# EasyEDA Pro project ProPrj_DRV8701 - 副本_2026-07-18.epro, board PCB1
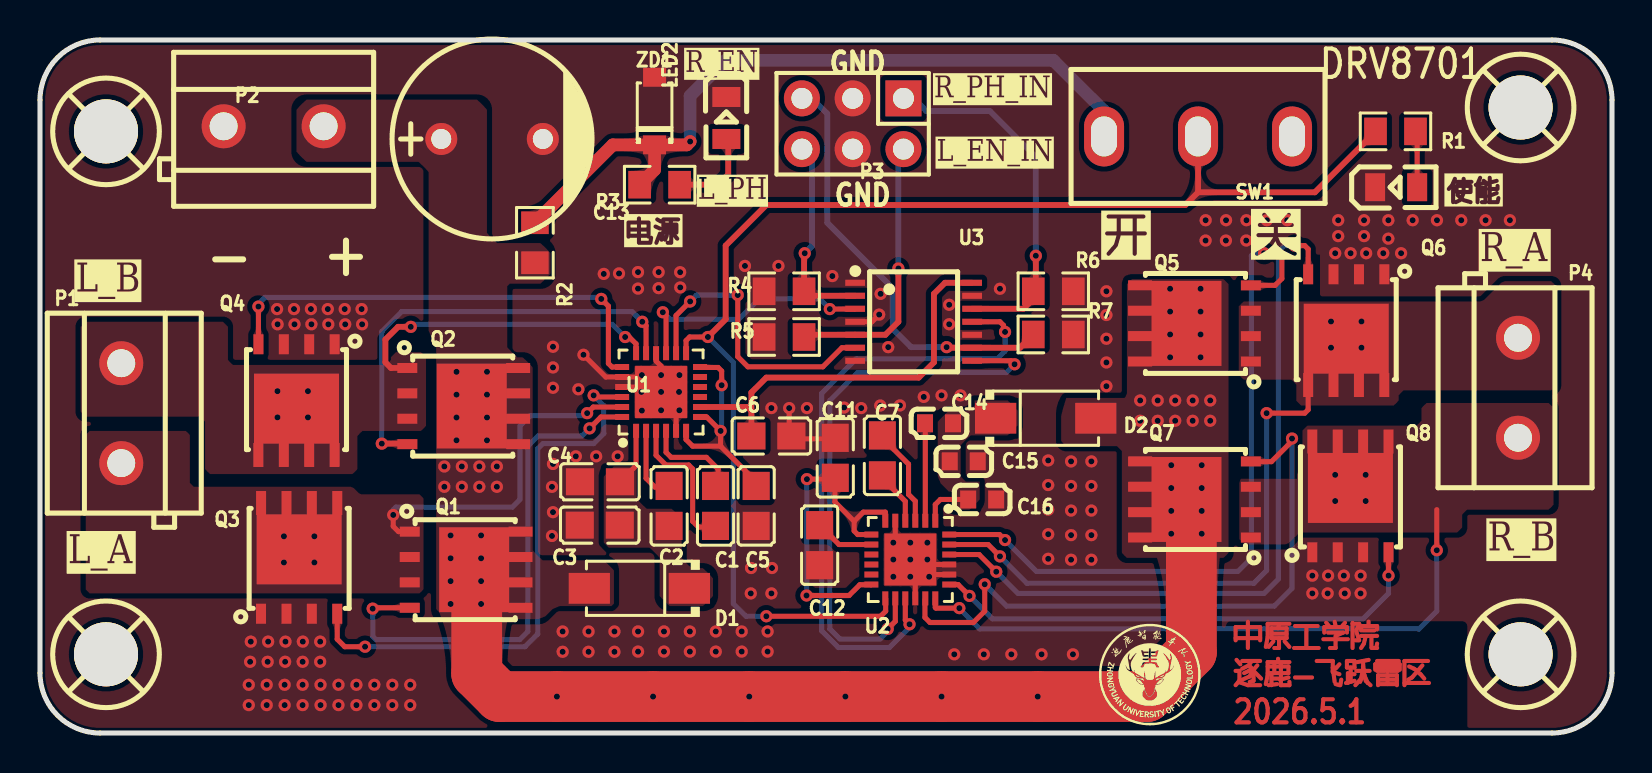
[diagram p4: board, top side]
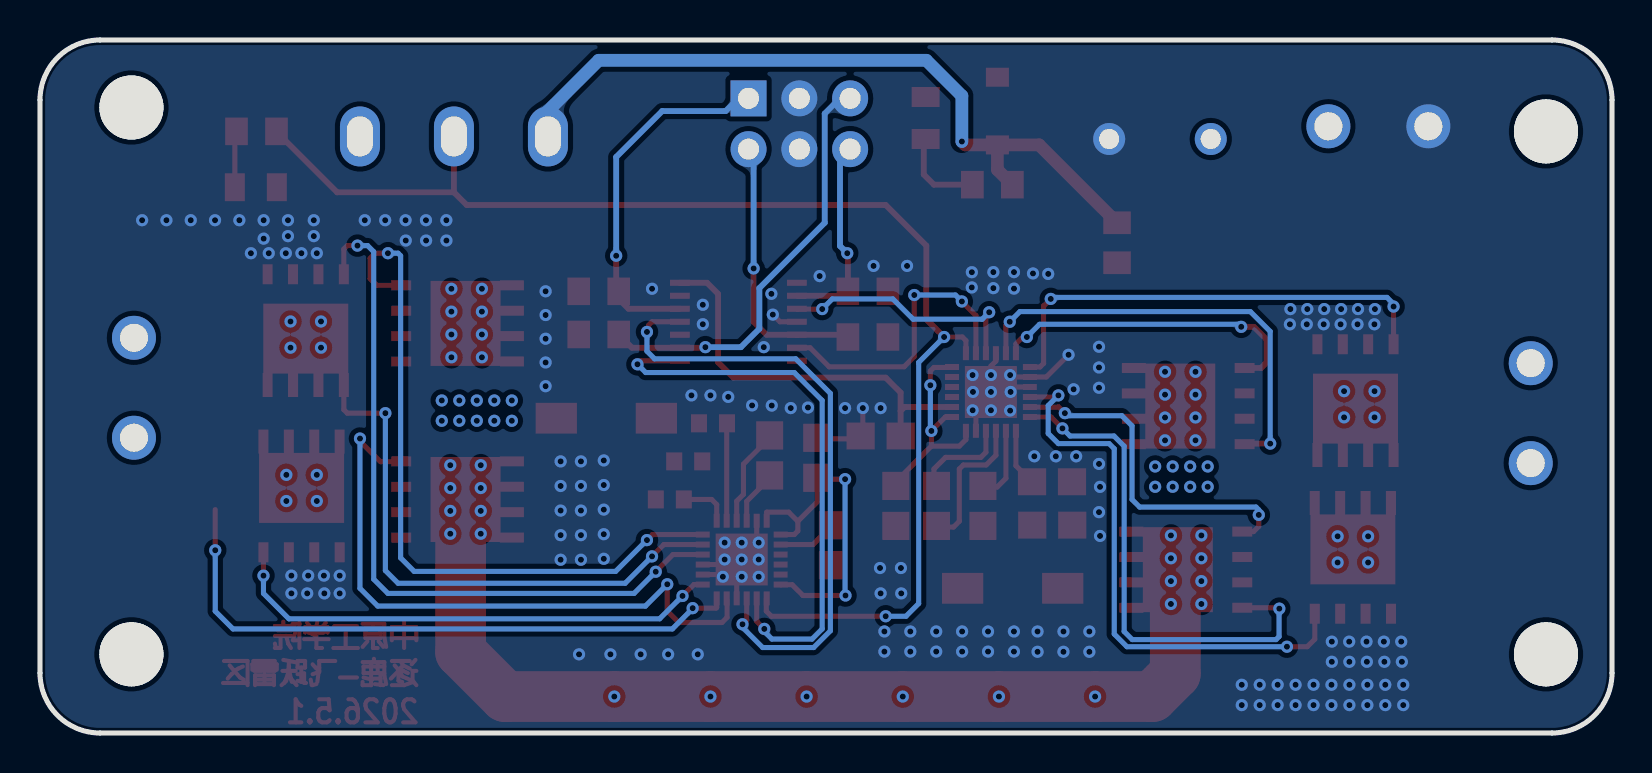
[diagram p5: board, bottom side, seen from below]

Outline 78.61 x 34.67 mm; copper layers: Top Layer, Bottom Layer. Coordinates in mm from the lower left corner of the outline.
Outline path: 0,31.67 0,3 arc(0.88,0.88) 3,0 75.61,0 arc(77.73,0.88) 78.61,3 78.61,31.67 arc(77.73,33.79) 75.61,34.67 3,34.67 arc(0.88,33.79) 0,31.67
Stack: Top Layer 0.035mm / Dielectric1 1.51mm FR4 er 4.5 / Bottom Layer 0.035mm

## Design rules (mm)
template: 自定义配置
spacing copperThickness1oz (default): track to track 0.102, other pairs 0.152 to 0.3
spacing copperThickness2oz: track to track 0.203, other pairs 0.152 to 0.3
track width copperThickness1oz (default): min 0.127, default 0.254, max 2.54
track width copperThickness2oz: min 0.203, default 0.254, max 2.54
differential pair differentialPair (default): width min 0.127, default 0.254, max 2.54; gap min 0.152, default 0.152
via viaSize (default): diameter min 0.5, default 0.61, max 10; hole min 0.3, default 0.305, max 6.3

## Placement (name value [footprint] x y rotation side)
C1  100nF  [C0805]  33.78 11.36 270 top
C2  1uF  [C0805]  31.46 11.36 270 top
C3  10uF  [C0805]  27.99 10.4 180 top
C4  100nF  [C0805]  28 12.57 180 top
C5  1uF  [C0805]  35.81 11.36 90 top
C6  1uF  [C0805]  36.58 14.86 180 top
C7  100nF  [C0805]  42.13 13.89 90 top
C11  1uF  [C0805]  39.77 13.77 270 top
C12  1uF  [C0805]  38.99 9.4 90 top
C13  470uF  [CAP-TH_BD10.0-P5.00-D1.0-FD]  22.61 29.72 0 top
C14  1uF  [C0603]  44.96 15.49 0 top
C15  1uF  [C0603]  46.2 13.59 0 top
C16  1uF  [C0603]  47.12 11.68 0 top
D1  SS54  [SMA_L4.4-W2.8-LS5.4-R-RD]  29.97 7.24 180 top
D2  SS54  [SMA_L4.4-W2.8-LS5.4-R-RD]  50.29 15.75 0 top
LED1  NCD0805R1  [LED0805-R-RD]  67.82 27.31 0 top
LED2  NCD0805R1  [LED0805-R-RD]  34.32 30.77 270 top
P1  KF301-5.0-2P  [CONN-TH_P5.00_KF301-5.0-2P]  4.06 16 270 top
P2  KF301-5.0-2P  [CONN-TH_P5.00_KF301-5.0-2P]  11.68 30.35 180 top
P3  2.54-2*3P针  [HDR-TH_6P-P2.54-V-M-R2-C3-S2.54-1]  40.64 30.48 180 top
P4  KF301-5.0-2P  [CONN-TH_P5.00_KF301-5.0-2P]  73.91 17.27 90 top
Q1  TPH1R403NL,L1Q(M  [DSOP-8_L5.0-W5.0-P1.27-LS6.0-BL-EP]  21.26 8.17 270 top
Q2  TPH1R403NL,L1Q(M  [DSOP-8_L5.0-W5.0-P1.27-LS6.0-BL-EP]  21.14 16.36 270 top
Q3  TPH1R403NL,L1Q(M  [DSOP-8_L5.0-W5.0-P1.27-LS6.0-BL-EP]  12.96 8.74 0 top
Q4  TPH1R403NL,L1Q(M  [DSOP-8_L5.0-W5.0-P1.27-LS6.0-BL-EP]  12.83 16.68 180 top
Q5  TPH1R403NL,L1Q(M  [DSOP-8_L5.0-W5.0-P1.27-LS6.0-BL-EP]  57.78 20.49 90 top
Q6  TPH1R403NL,L1Q(M  [DSOP-8_L5.0-W5.0-P1.27-LS6.0-BL-EP]  65.32 20.18 180 top
Q7  TPH1R403NL,L1Q(M  [DSOP-8_L5.0-W5.0-P1.27-LS6.0-BL-EP]  57.78 11.68 90 top
Q8  TPH1R403NL,L1Q(M  [DSOP-8_L5.0-W5.0-P1.27-LS6.0-BL-EP]  65.53 11.81 0 top
R1  330Ω  [R0805]  67.79 30.1 0 top
R2  2.2kΩ  [R0805]  24.75 24.53 90 top
R3  1kΩ  [R0805]  30.99 27.43 180 top
R4  10kΩ  [R0805]  37.21 22.1 180 top
R5  10kΩ  [R0805]  37.21 19.81 180 top
R6  10kΩ  [R0805]  50.67 22.1 180 top
R7  10kΩ  [R0805]  50.67 19.94 180 top
SCREW1  -  [M3螺丝]  3.3 3.94 0 top
SCREW2  -  [M3螺丝]  74.04 3.94 0 top
SCREW3  -  [M3螺丝]  74.04 31.29 0 top
SCREW4  -  [M3螺丝]  3.3 30.1 0 top
SW1  SS-12D10L5  [SW-TH_SS-12D10L5]  57.91 29.84 180 top
U1  DRV8701ERGET  [VQFN-24_L4.0-W4.0-P0.50-BL-EP2.5]  31.06 17.06 0 top
U2  DRV8701ERGET  [VQFN-24_L4.0-W4.0-P0.50-BL-EP2.5]  43.52 8.68 180 top
U3  SN74HC125PWR  [TSSOP-14_L5.0-W4.4-P0.65-LS6.5-BL]  43.69 20.57 270 top
ZD1  BZT52C3V3  [SOD-123_L2.8-W1.8-LS3.7-RD]  30.73 31.12 90 top

## Footprints (pads in the part's own frame, mm; a bottom-side part is the same pattern mirrored in y, then rotated)
C0603
  rect 0.8x0.9 smd: 1(-0.7,0) 2(0.7,0)
C0805
  rect 1.41x1.35 smd: 1(-1,0) 2(1,0)
CAP-TH_BD10.0-P5.00-D1.0-FD
  round 1.6 hole 1: 1(-2.54,0) 2(2.54,0)
CONN-TH_P5.00_KF301-5.0-2P
  round 2.2 hole 1.4: 1(-2.5,0) 2(2.5,0)
DSOP-8_L5.0-W5.0-P1.27-LS6.0-BL-EP
  rect 0.5x1 smd: 1(-1.905,-2.77) 2(-0.635,-2.77) 3(0.634,-2.77) 4(1.905,-2.77)
  rect 0.5x1.2 smd: 5(1.905,2.77) 6(0.635,2.77) 7(-0.634,2.77) 8(-1.905,2.77)
  custom 4.25x3.5 smd: 9(0,0.45)
HDR-TH_6P-P2.54-V-M-R2-C3-S2.54-1
  rect 1.8x1.8 hole 1.05: 1(-2.54,-1.27)
  round 1.8 hole 1.05: 2(-2.54,1.27) 3(0,-1.27) 4(0,1.27) 5(2.54,-1.27) 6(2.54,1.27)
LED0805-R-RD
  rect 1x1.399 smd: 1(1.05,0) 2(-1.05,0)
M3螺丝
  round 3.2 hole 3.2: 1(0,0)
R0805
  rect 1.133x1.377 smd: 1(-1,0) 2(1,0)
SMA_L4.4-W2.8-LS5.4-R-RD
  rect 2.062x1.539 smd: 1(2.503,0) 2(-2.503,0)
SOD-123_L2.8-W1.8-LS3.7-RD
  rect 0.95x1.15 smd: 1(-1.692,0) 2(1.692,0)
SW-TH_SS-12D10L5
  oval 2x3 hole 1.3x2: 1(-4.7,0) 2(0,0) 3(4.7,0)
TSSOP-14_L5.0-W4.4-P0.65-LS6.5-BL
  rect 0.305x0.991 smd: 1(-1.95,-2.925) 2(-1.3,-2.925) 3(-0.65,-2.925) 4(0,-2.925) 5(0.65,-2.925) 6(1.3,-2.925) 7(1.95,-2.925) 8(1.95,2.925) 9(1.3,2.925) 10(0.65,2.925) 11(0,2.925) 12(-0.65,2.925) 13(-1.3,2.925) 14(-1.95,2.925)
VQFN-24_L4.0-W4.0-P0.50-BL-EP2.5
  rect 0.3x0.7 smd: 1(-1.25,-1.942) 2(-0.75,-1.942) 3(-0.25,-1.942) 4(0.25,-1.942) 5(0.75,-1.942) 6(1.25,-1.942) 13(1.25,1.942) 14(0.75,1.942) 15(0.25,1.942) 16(-0.25,1.942) 17(-0.75,1.942) 18(-1.25,1.942)
  rect 0.7x0.3 smd: 7(1.948,-1.25) 8(1.948,-0.75) 9(1.948,-0.25) 10(1.948,0.25) 11(1.948,0.75) 12(1.948,1.25) 19(-1.948,1.25) 20(-1.948,0.75) 21(-1.948,0.25) 22(-1.948,-0.25) 23(-1.948,-0.75) 24(-1.948,-1.25)
  rect 2.6x2.6 smd: 25(0.001,-0.001)

## Nets
As in the schematic.

Pads without a net: SCREW1 1; SCREW2 1; SCREW3 1; SCREW4 1; SW1 1; U1 9 10 11; U2 9 10 11

## Via types
v1: diameter 0.61, hole 0.305, Top Layer to Bottom Layer, 293 vias

## Routing (per net, layer and track width the routed paths; a pad name or vN(x,y) marks a point on that pad's centre or on a via; arc(x,y) is an arc through that point)
3V3: length 37.8
  Top Layer w0.635: v1(32.51,29.59) 32.34,29.42 ZD1.1 ; ZD1.1 28.64,29.42 R2.2 ; ZD1.1 30.73,28.18 R3.2
  Bottom Layer w0.635: v1(32.51,29.59) 32.51,31.88 34.29,33.66 50.67,33.66 53.21,31.12 SW1.3
DVDD: length 20.1
  Top Layer w0.292: U1.8 35.38,16.31 35.58,16.11 ; C6.2 35.58,16.11 ; 35.58,16.11 35.58,17.03 36.32,17.78 43.94,17.78 44.7,18.54 44.7,21.97 45.26,22.52 U3.14
GND: length 16.5
  Top Layer w0.254: U1.5 31.81,15.98 v1(31.97,16.15) ; v1(44.46,7.82) 44.58,7.93 U2.20 ; U1.16 30.81,18.61 31.06,18.36 v1(31.06,17.91) ; 42.77,10.62 42.77,9.62 v1(42.67,9.53) ; v1(30.08,17.06) 29.83,17.31 U1.21 ; U2.21 44.63,8.43 v1(44.38,8.68) ; v1(30.1,17.91) 30,17.81 U1.20 28.29,17.81 v1(27.18,18.92) ; U2.16 43.77,7.57 v1(43.52,7.82) ; v1(41.97,20.93) 41.61,20.57 U3.4 ; 39.88,14.72 37.72,14.72 37.47,14.97 v1(37.47,16.26)
  vias: v1(10.51,3.56) v1(10.44,2.41) v1(10.44,1.4) v1(10.54,4.57) v1(11.41,4.57) v1(11.38,3.56) v1(11.34,2.41) v1(11.34,1.4) v1(11.86,21.21) v1(11.88,20.45) v1(12.28,4.57) v1(12.26,3.56) v1(12.23,2.41) v1(12.23,1.4) v1(12.7,21.21) v1(12.73,20.45) v1(13.14,4.57) v1(13.14,3.56) v1(13.13,2.41) v1(13.13,1.4) v1(13.55,21.21) v1(13.57,20.45) v1(14.01,4.57) v1(14.01,3.56) v1(14.03,2.41) v1(14.03,1.4) v1(14.39,21.21) v1(14.42,20.45) v1(14.93,2.41) v1(14.93,1.4) v1(15.24,21.21) v1(15.26,20.45) v1(15.82,2.41) v1(15.82,1.4) v1(16.08,21.21) v1(16.11,20.45) v1(16.72,2.41) v1(16.72,1.4) v1(17.62,2.41) v1(17.62,1.4) v1(18.52,2.41) v1(18.52,1.4) v1(25.6,12.32) v1(25.6,9.86) v1(25.65,19.32) v1(25.65,18.29) v1(25.65,17.27) v1(25.65,13.46) v1(25.65,11.05) v1(26.14,5.08) v1(26.14,4.06) v1(26.8,13.84) v1(26.92,17.2) v1(27.43,5.08) v1(27.43,4.06) v1(27.81,13.84) v1(28.19,22.97) v1(28.73,5.08) v1(28.73,4.06) v1(28.89,13.84) v1(28.96,22.99) v1(29.91,23.06) v1(29.91,22.23) v1(29.91,5.08) v1(29.91,4.07) v1(30.1,16.13) v1(30.94,23.06) v1(30.94,22.26) v1(31.06,17.06) v1(31.06,16.15) v1(31.2,5.08) v1(31.2,4.07) v1(32.01,23.05) v1(32.02,22.29) v1(31.98,17.91) v1(31.96,17.06) v1(32.5,5.08) v1(32.5,4.07) v1(33.8,5.08) v1(33.8,4.07) v1(35.09,5.08) v1(35.09,4.07) v1(35.25,23.37) v1(35.56,8.26) v1(35.54,6.98) v1(36.39,5.08) v1(36.39,4.07) v1(36.58,16.26) v1(36.61,8.26) v1(36.58,6.98) v1(36.93,23.37) v1(38.35,16.26) v1(39.62,22.86) v1(40.21,16.28) v1(41.07,16.26) v1(42.02,16.38) v1(42.04,21.97) v1(42.42,19.3) v1(42.67,8.68) v1(42.67,7.82) v1(43,16.39) v1(43.52,9.53) v1(43.52,8.68) v1(44.2,16.82) v1(44.38,9.53) v1(45.08,16.89) v1(45.47,21.42) v1(45.47,20.45) v1(45.72,3.94) v1(46.04,16.89) v1(47.2,3.94) v1(48.01,22.23) v1(48.58,3.94) v1(50.09,3.94) v1(50.42,13.64) v1(50.42,12.41) v1(50.42,11.18) v1(50.42,9.95) v1(50.42,8.72) v1(51.56,13.59) v1(51.56,12.36) v1(51.56,11.13) v1(51.56,9.9) v1(51.56,8.67) v1(51.66,3.94) v1(52.58,13.59) v1(52.58,12.36) v1(52.58,11.13) v1(52.58,9.9) v1(52.58,8.67) v1(53.33,22.1) v1(53.33,20.91) v1(53.33,19.72) v1(53.33,18.54) v1(53.33,17.35) v1(58.29,25.65) v1(58.29,24.64) v1(59.31,25.65) v1(59.31,24.64) v1(60.32,24.64) v1(60.33,25.65) v1(61.35,25.65) v1(62.37,25.65) v1(63.63,7.87) v1(63.63,6.98) v1(64.42,7.87) v1(64.39,6.98) v1(64.77,24) v1(64.92,25.65) v1(64.92,24.86) v1(65.2,7.87) v1(65.25,6.98) v1(65.54,24) v1(66.04,7.87) v1(66.04,6.98) v1(66.21,25.65) v1(66.21,24.86) v1(66.32,24) v1(67.17,24) v1(67.43,25.65) v1(67.43,24.73) v1(68.07,24) v1(68.64,25.65) v1(69.86,25.65) v1(71.08,25.65) v1(72.29,25.65) v1(73.51,25.65)
L_A: length 17.5
  Top Layer w0.254: v1(17.66,10.91) 17.66,10.34 17.93,10.08 Q1.1 ; U1.23 29.11,16.31 27.67,16.31 v1(27.36,16)
  Bottom Layer w0.254: v1(27.36,16) 27.23,15.88 24.51,15.88 24,15.37 24,11.68 23.62,11.3 17.8,11.3 17.66,11.17 v1(17.66,10.91)
  vias: v1(12.2,9.84) v1(12.2,8.53) v1(13.72,9.84) v1(13.72,8.53)
L_B: length 16.1
  Top Layer w0.254: v1(29.26,19.81) 29.46,19.81 29.81,19.47 U1.18
  Top Layer w0.292: v1(18.54,20.32) 17.91,20.32 17.27,19.69 17.27,18.54 17.55,18.26 Q2.1
  Bottom Layer w0.254: v1(29.26,19.81) 28.63,20.45 18.67,20.45 v1(18.54,20.32)
  vias: v1(11.88,17.1) v1(11.88,15.79) v1(13.4,17.1) v1(13.4,15.79)
L_EN: length 15
  Top Layer w0.254: U3.6 40.1,19.27 39.15,18.32 35.4,18.32 34.89,18.83 v1(34.89,21.91) ; v1(32.51,21.59) 31.81,20.89 U1.14
  Bottom Layer w0.254: v1(34.89,21.91) 32.83,21.91 v1(32.51,21.59)
L_EN_IN: length 13.8
  Top Layer w0.292: v1(42.93,23.24) 42.93,20.57 42.28,19.92 U3.5 38.32,19.92 R5.1
  Bottom Layer w0.292: P3.2 42.93,28.96 v1(42.93,23.24)
L_PH: length 12.5
  Top Layer w0.254: v1(31.15,21.05) 31.31,20.89 U1.15 ; U3.3 40.75,21.21 v1(39.5,21.21)
  Bottom Layer w0.254: v1(39.5,21.21) 38.99,21.72 35.97,21.72 34.95,20.7 31.5,20.7 v1(31.15,21.05)
L_PH_IN: length 10.1
  Top Layer w0.292: U3.2 38.44,21.87 R4.1 38.21,23.97 v1(38.24,24)
  Bottom Layer w0.292: v1(38.24,24) 38.61,24.37 38.61,28.7 P3.6
NSLEEP: length 66.9
  Top Layer w0.254: 42.29,6.72 42.29,6.1 42.04,5.84 v1(36.32,5.84) ; v1(33.4,19.81) 32.49,19.81 32.31,19.63 U1.13
  Top Layer w0.292: 57.91,27.05 SW1.2 ; 57.91,27.05 63.75,27.05 66.79,30.08 R1.1 ; 57.91,27.05 57.28,26.42 36.32,26.42 34.29,24.38 34.29,20.7 v1(33.4,19.81)
  Bottom Layer w0.254: v1(36.32,5.84) 35.31,5.84 34.67,6.48 34.67,18.54 v1(33.4,19.81)
R_A: length 28.2
  Top Layer w0.254: U2.23 47.41,9.43 v1(48.01,8.84) ; 63.42,17.41 63.42,16.17 63.25,16 v1(61.34,16)
  Bottom Layer w0.254: v1(61.34,16) 61.34,8.13 60.71,7.49 49.35,7.49 v1(48.01,8.84)
  vias: v1(64.56,20.59) v1(64.56,19.28) v1(66.08,20.59) v1(66.08,19.28)
R_B: length 31.4
  Top Layer w0.254: 69.85,11.18 v1(69.85,9.14) ; U2.18 44.77,6.28 44.81,6.25 v1(45.97,6.25)
  Bottom Layer w0.254: v1(45.97,6.25) 45.97,6.22 46.99,5.21 68.96,5.21 69.85,6.1 v1(69.85,9.14)
  vias: v1(64.77,12.92) v1(64.77,11.61) v1(66.29,12.92) v1(66.29,11.61)
R_EN: length 28.7
  Top Layer w0.254: U2.14 42.77,5.59 v1(42.39,5.21) ; U3.8 48.56,18.62 v1(48.74,18.45)
  Bottom Layer w0.254: v1(48.74,18.45) 48.32,18.03 40.89,18.03 39.5,16.64 39.5,5.21 40.01,4.7 42.01,4.7 42.39,5.08 v1(42.39,5.21)
R_EN_IN: length 21.4
  Top Layer w0.292: v1(45.34,19.3) 45.37,19.27 U3.9 49.01,19.27 R7.2
  Bottom Layer w0.292: v1(45.34,19.3) 43.56,19.3 42.64,20.23 42.64,22.26 39.37,25.53 39.37,30.99 38.61,31.75 P3.5
R_PH: length 31.6
  Top Layer w0.254: U3.11 48.01,20.57 48.19,20.39 48.19,20.14 v1(48.26,20.07) ; U2.15 43.27,5.65 v1(43.48,5.44)
  Bottom Layer w0.254: v1(48.26,20.07) 48.26,19.1 47.88,18.72 40.82,18.72 39.09,16.99 39.09,5.11 39.92,4.28 42.47,4.28 43.48,5.29 v1(43.48,5.44)
R_PH_IN: length 17.9
  Top Layer w0.292: U3.12 49.18,21.22 49.8,21.84 v1(49.8,23.88)
  Bottom Layer w0.292: v1(49.8,23.88) 49.8,28.81 47.5,31.12 44.32,31.12 43.56,31.88
VM: length 49.7
  Top Layer w2.54: 57.58,11.55 57.58,4.05 55.35,1.82 v1(49.89,1.82) v1(45.08,1.82) v1(40.28,1.82) v1(35.47,1.82) v1(30.66,1.82) v1(25.85,1.82) 22.99,1.82 21.84,2.97 21.84,8.04
  vias: v1(20.22,13.34) v1(20.22,12.32) v1(20.53,9.89) v1(20.53,8.74) v1(20.53,7.6) v1(20.53,6.46) v1(20.83,18.07) v1(20.83,16.93) v1(20.83,15.79) v1(20.83,14.64) v1(21.1,13.34) v1(21.1,12.32) v1(21.97,13.34) v1(21.97,12.32) v1(22.06,9.89) v1(22.06,8.74) v1(22.06,7.6) v1(22.06,6.46) v1(22.35,18.07) v1(22.35,16.93) v1(22.35,15.79) v1(22.35,14.64) v1(22.85,13.34) v1(22.85,12.32) v1(55.02,16.64) v1(55.02,15.62) v1(55.89,16.64) v1(55.89,15.62) v1(56.52,22.23) v1(56.52,21.08) v1(56.52,19.94) v1(56.52,18.8) v1(56.57,13.4) v1(56.57,12.26) v1(56.57,11.11) v1(56.57,9.97) v1(56.77,16.64) v1(56.77,15.62) v1(57.64,16.64) v1(57.64,15.62) v1(58.04,22.23) v1(58.04,21.08) v1(58.04,19.94) v1(58.04,18.8) v1(58.1,13.4) v1(58.1,12.26) v1(58.1,11.11) v1(58.1,9.97) v1(58.52,16.64) v1(58.52,15.62)
$1N149: length 2.9
  Top Layer w0.254: C4.1 29.81,13.37 U1.1
$1N154: length 7.5
  Top Layer w0.254: 34.04,10.3 32.93,10.3 32.64,10.59 32.64,13.21 32.44,13.41 31.29,13.41 30.81,13.9 U1.3
$1N162: length 5
  Top Layer w0.254: 34.04,12.3 33.91,12.43 33.91,13.21 33.33,13.79 31.56,13.79 31.31,14.04 U1.4
$1N169: length 3.7
  Top Layer w0.254: 31.5,12.3 30.75,12.3 30.31,12.74 U1.2
$1N592: length 11.8
  Top Layer w0.254: U1.6 32.31,14.68 32.64,14.35 34.04,14.35 ; 36.31,12.26 36.22,12.17 34.04,14.35 ; 34.04,14.35 v1(34.04,15.11) 33.34,15.81 U1.7 ; U1.12 33.03,18.29 33.91,18.29 34.09,18.11 v1(34.09,17.4)
  Bottom Layer w0.254: v1(34.09,17.4) 34.09,15.17 v1(34.04,15.11)
$1N1655: length 28.2
  Top Layer w0.254: U1.22 27.77,16.81 v1(27.69,16.89) ; v1(16.26,4.32) 15.24,4.32 14.86,4.69 14.86,5.97
  Bottom Layer w0.254: v1(16.26,4.32) 24.26,4.32 24.89,4.95 24.89,14.22 25.15,14.48 27.69,14.48 28.19,14.99 28.19,16.38 v1(27.69,16.89)
$1N1671: length 25.8
  Top Layer w0.254: v1(27.48,15.24) 28.05,15.81 U1.24 ; Q1.4 16.68,6.27 v1(16.64,6.22)
  Bottom Layer w0.254: v1(27.48,15.24) 27.1,14.86 24.9,14.86 24.4,14.35 24.4,5.08 23.99,4.67 16.8,4.67 16.65,4.83 16.65,5.96 16.64,5.97 v1(16.64,6.22)
$1N1819: length 22.2
  Top Layer w0.254: U1.17 30.31,20.38 v1(30.12,20.57)
  Top Layer w0.292: v1(17.09,14.48) 18.35,14.48 Q2.4
  Bottom Layer w0.254: v1(17.09,14.48) 17.09,20.09 18.08,21.08 29.61,21.08 v1(30.12,20.57)
$1N1864: length 23.5
  Top Layer w0.254: Q4.4 v1(10.92,21.33) ; v1(28.07,21.72) 28.42,21.36 28.42,18.49 28.6,18.31 U1.19
  Bottom Layer w0.254: v1(10.92,21.33) 10.92,21.46 11.25,21.79 27.99,21.79 v1(28.07,21.72)
$1N2152: length 2.6
  Top Layer w0.254: 42.13,12.74 43.27,11.59 43.27,10.62
$1N2237: length 4.8
  Top Layer w0.254: 43.77,10.62 43.77,11.6 43.43,11.94 43.43,13.45 42.13,14.76
$1N2243: length 4.9
  Top Layer w0.254: 44.27,10.62 44.27,15.48 44.26,15.49
$1N2285: length 2.6
  Top Layer w0.254: 44.77,10.62 44.77,11.43 45.03,11.68 C16.1
$1N2538: length 16.8
  Top Layer w0.254: v1(38.33,6.88) 40.46,6.88 41,7.42 41.56,7.42 41.57,7.43 ; 40.71,10.59 40.71,10.11 40.89,9.93 41.57,9.93 ; 40.71,10.59 39.75,11.56 39.75,12.7 v1(38.35,12.7) ; 40.71,10.59 41.17,11.05 42.27,11.05 42.27,10.62
  Bottom Layer w0.254: v1(38.33,6.88) 38.35,6.9 v1(38.35,12.7)
$1N2549: length 3
  Top Layer w0.254: 41.57,9.43 39.96,9.43 C12.2
$1N2904: length 35.7
  Top Layer w0.254: v1(48.26,9.65) 47.98,9.93 U2.24 ; v1(61.21,24) 61.85,24 62.1,23.75 62.1,22.73 61.77,22.4 Q5.4
  Bottom Layer w0.254: v1(48.26,9.65) 49.83,8.09 59.9,8.09 60.58,8.76 60.58,23.88 60.71,24 v1(61.21,24)
$1N3052: length 36.9
  Top Layer w0.254: U2.22 46.96,8.93 v1(47.82,8.07) ; Q6.4 63.42,24.21 63.25,24.38 v1(62.74,24.38)
  Bottom Layer w0.254: v1(62.74,24.38) 62.23,24.38 61.92,24.08 61.92,7.7 61.21,6.98 48.91,6.98 v1(47.82,8.07)
$1N3089: length 25.3
  Top Layer w0.254: U2.19 45.91,7.43 v1(46.48,6.86) ; v1(67.44,7.87) Q8.4
  Bottom Layer w0.254: v1(67.44,7.87) 67.44,6.98 66.17,5.72 47.63,5.72 v1(46.48,6.86)
$1N3233: length 31.7
  Top Layer w0.254: v1(47.24,7.44) 47.24,6.1 46.68,5.53 44.51,5.53 44.26,5.78 44.26,6.67 ; 60.67,13.58 61.58,13.58 62.61,14.61 v1(62.61,14.73)
  Bottom Layer w0.254: v1(62.61,14.73) 62.61,7.24 61.72,6.35 48.34,6.35 v1(47.24,7.44)
$1N3927: length 2.8
  Top Layer w0.254: LED1.1 68.87,30.02 R1.2
$1N4420: length 4.5
  Top Layer w0.292: 34.71,29.72 34.42,29.43 34.42,27.94 33.91,27.43 R3.1

## Copper pours and planes (outline as drawn; the poured copper is in the pictures)
GND on Top Layer: -1.78,35.18 80.14,35.18 80.14,-1.91 -1.78,-1.91
GND on Bottom Layer: -4.83,38.99 92.08,38.99 92.08,-16.13 -4.83,-16.13
L_A on Top Layer: 2.29,15.11 19.18,15.11 19.18,6.98 2.29,6.98
L_B on Top Layer: 2.03,20.57 19.3,20.57 19.3,12.95 2.03,12.95
R_A on Top Layer: 59.94,22.61 75.82,22.61 75.82,16.38 59.94,16.38
R_B on Top Layer: 59.98,16.51 75.69,16.51 75.69,9.44 59.98,9.44
VM on Top Layer: 51.07,22.7 59.44,22.7 59.44,8.76 51.07,8.76
VM on Top Layer: 12.83,31.69 28.7,31.69 28.7,5.7 12.83,5.7
$1N149 on Top Layer: 28.19,13.34 33.66,13.34 33.66,6.35 28.19,6.35
$1N2285 on Top Layer: 44.9,16.64 48.89,16.64 48.89,11.18 44.9,11.18

Small or netless copper shapes (teardrops, artwork), in the pictures only: 127 on Top Layer, 36 on Bottom Layer

## Text on the board
Top Layer: 中原工学院 / 逐鹿—飞跃雷区 / 2026.5.1
Top Solder Mask Layer: 中原工学院 / 逐鹿—飞跃雷区 / 2026.5.1
Top Silkscreen Layer: GND | DRV8701 | - | + | 电源 | R_EN | L_PH | R_PH_IN | L_EN_IN | 使能 | L_A | L_B | R_A | R_B | 开 | 关
